# Altium schematic sheet synth-schematic.SchDoc
size B; SheetNumber: 1; SheetTotal: 3
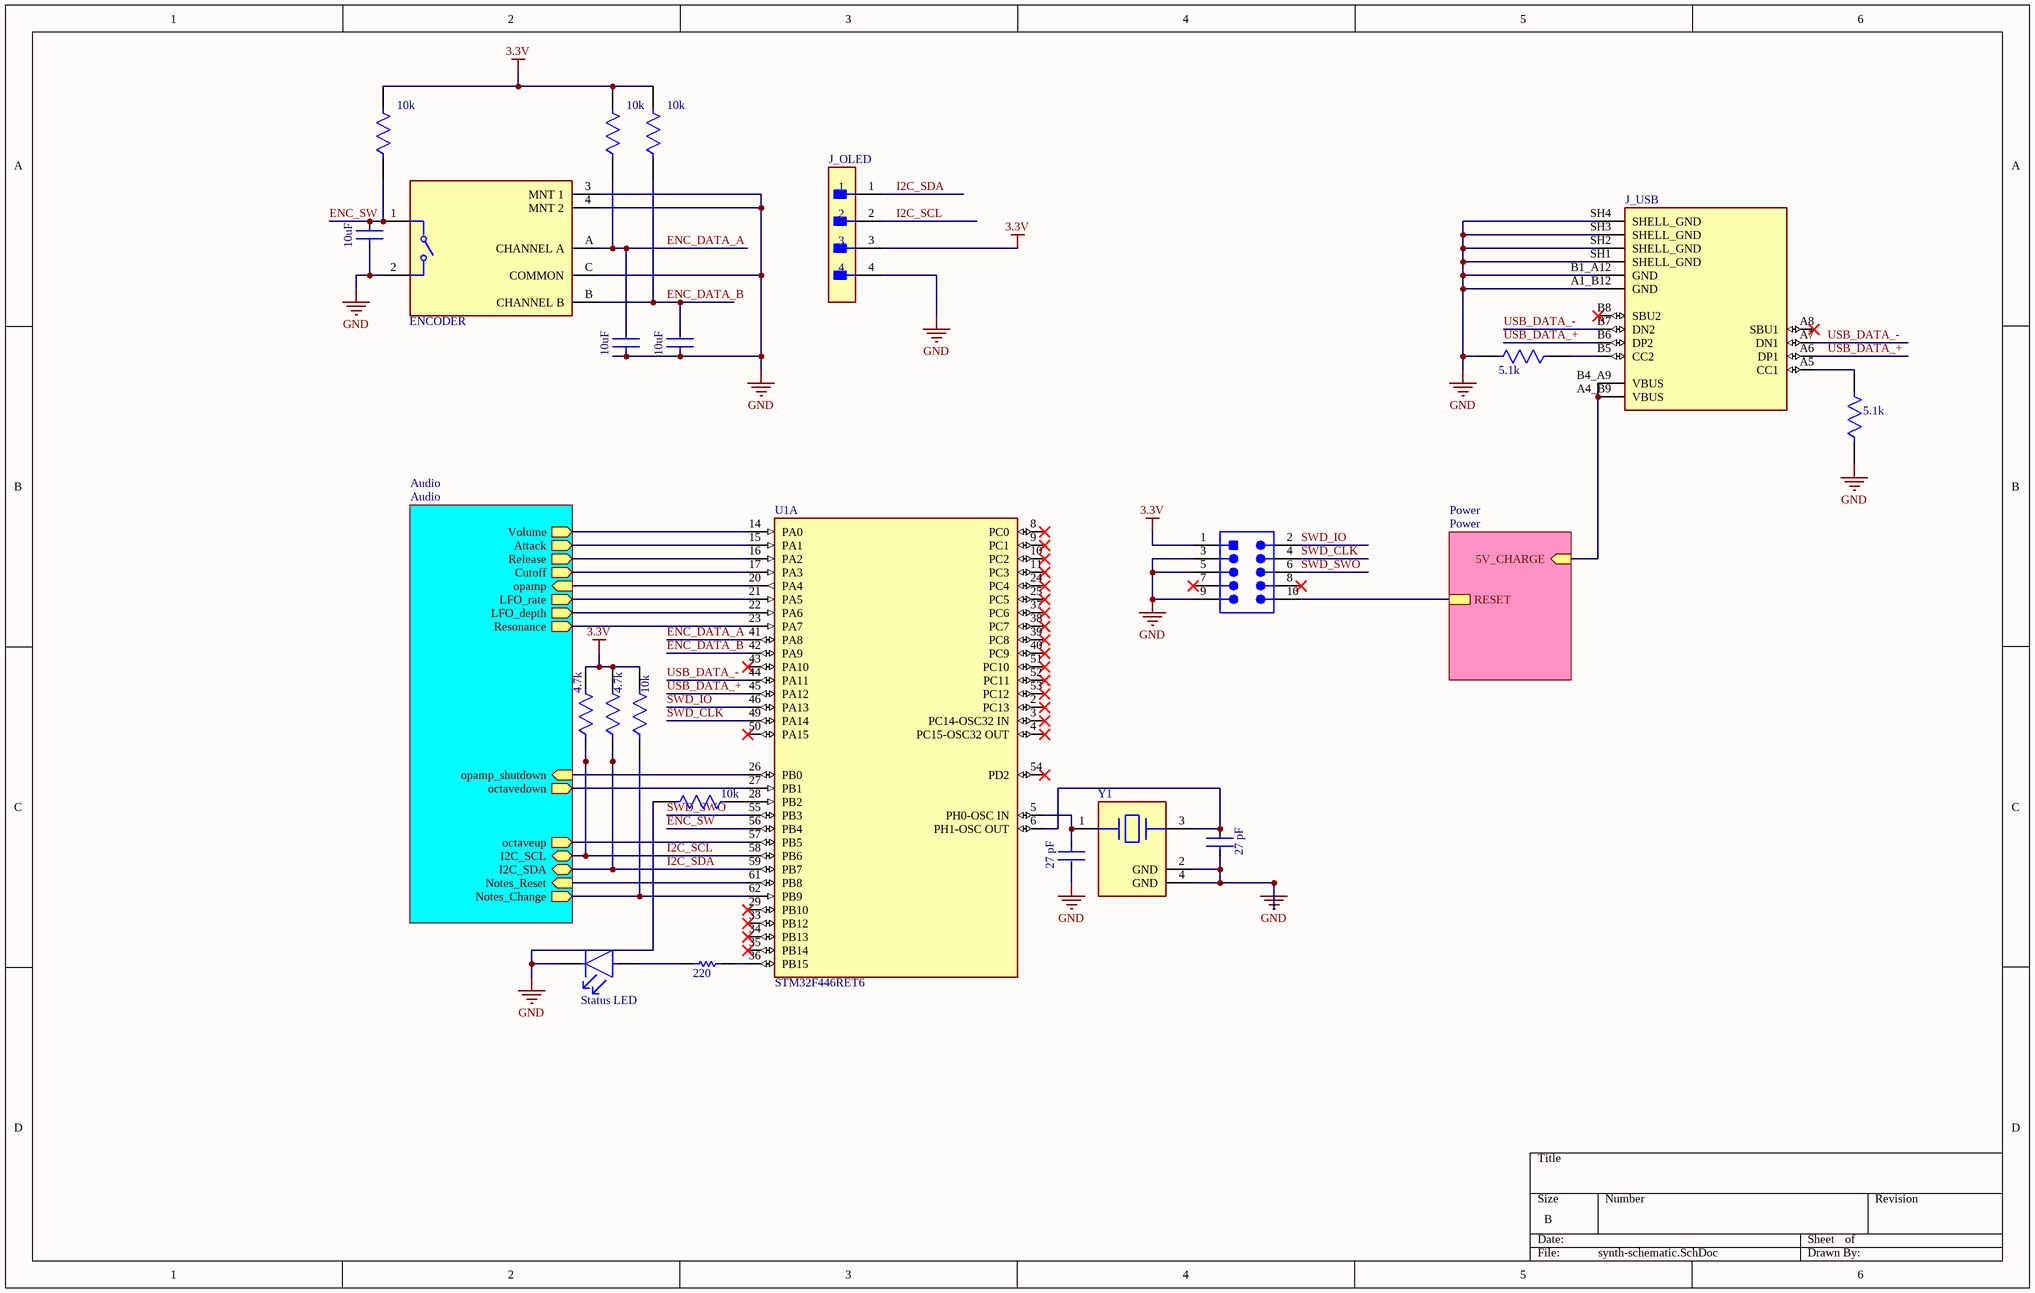
[diagram p0: synth-schematic.SchDoc]

## Parts
C_ENC_A  10uF  [FP-C0603C106M8PACTU-MFG]
C_ENC_B  10uF  [FP-C0603C106M8PACTU-MFG]
C_ENC_SW  10uF  [FP-C0603C106M8PACTU-MFG]
C_Y_1  27 pF  [FP-C0603C-CF-MFG]
C_Y_2  27 pF  [FP-C0603C-CF-MFG]
ENCODER  PEC11R-4215F-S0024  [FP-PEC11R-4215F-S0024-MFG]  (value not drawn)
J_OLED  HTSW-104-07-G-S  [FP-HTSW-104-07-G-S-MFG]  (value not drawn)
J_USB  USB4105-GF-A-120  [GCT_USB4105-GF-A-120]  (value not drawn)
LED_R1  220  [RESC1608X55X25NL10T15]
R_BOOT_PD  10k  [FP-AC0603-IPC_A]
R_ENC_PU_2  10k  [FP-AC0603-IPC_A]
R_ENC_PU_3  10k  [FP-AC0603-IPC_A]
R_ENC_PU_?  10k  [FP-AC0603-IPC_A]
R_NOTES_PU  10k  [FP-AC0603-IPC_A]
R_PULLUP_SCL  4.7k  [FP-RT0603-MFG]
R_PULLUP_SDA  4.7k  [FP-RT0603-MFG]
R_USB_1  5.1k  [FP-MCT0603-IPC_B]
R_USB_2  5.1k  [FP-MCT0603-IPC_B]
STATUS_LED1  Status LED  [FP-LTST-C190KRKT-MFG]
SWD_HEADER  FTSH-105-01-F-DV-K  [SMTC-FTSH-105-01-L-DV-K_V]  (value not drawn)
U1  STM32F446RET6  [FP-LQFP64-5W-MFG]  (part A of 2)
Y1  ABM3B-8.000MHZ-B2-T  [FP-ABM3B-MFG]  (value not drawn)

## Sub-sheets
Audio = Audio: Volume (out), Attack (out), Release (out), Cutoff (out), LFO_rate (out), LFO_depth (out), Resonance (out), opamp (in), opamp_shutdown (in), octavedown (out), Notes_Reset (in), Notes_Change (out), I2C_SDA (bidir), octaveup (out), I2C_SCL (bidir)
Power = Power: 5V_CHARGE (in), RESET

## Nets
3.3V: J_OLED.3 R_ENC_PU_2.2 R_ENC_PU_3.2 R_ENC_PU_?.2 R_NOTES_PU.2 R_PULLUP_SCL.2 R_PULLUP_SDA.2 SWD_HEADER.1
GND: C_ENC_A.1 C_ENC_B.1 C_ENC_SW.1 C_Y_1.1 C_Y_2.2 ENCODER.2 ENCODER.3(MNT_1) ENCODER.4(MNT_2) ENCODER.C(COMMON) J_OLED.4 J_USB.A1_B12(GND) J_USB.B1_A12(GND) J_USB.SH1(SHELL_GND) J_USB.SH2(SHELL_GND) J_USB.SH3(SHELL_GND) J_USB.SH4(SHELL_GND) R_BOOT_PD.2 R_USB_1.1 R_USB_2.2 STATUS_LED1.1(C) SWD_HEADER.3 SWD_HEADER.5 SWD_HEADER.9 Y1.2(GND) Y1.4(GND)
ENC_DATA_A: C_ENC_A.2 ENCODER.A(CHANNEL_A) R_ENC_PU_?.1 U1.41(PA8)
ENC_DATA_B: C_ENC_B.2 ENCODER.B(CHANNEL_B) R_ENC_PU_2.1 U1.42(PA9)
ENC_SW: C_ENC_SW.2 ENCODER.1 R_ENC_PU_3.1 U1.56(PB4)
I2C_SCL: J_OLED.2 R_PULLUP_SCL.1 U1.58(PB6) ; sheet Audio/I2C_SCL
I2C_SDA: J_OLED.1 R_PULLUP_SDA.1 U1.59(PB7) ; sheet Audio/I2C_SDA
SWD_CLK: SWD_HEADER.4 U1.49(PA14)
SWD_IO: SWD_HEADER.2 U1.46(PA13)
SWD_SWO: SWD_HEADER.6 U1.55(PB3)
USB_DATA_+: J_USB.A6(DP1) J_USB.B6(DP2) U1.45(PA12)
USB_DATA_-: J_USB.A7(DN1) J_USB.B7(DN2) U1.44(PA11)
NetC_Y_1_2: C_Y_1.2 U1.6(PH1-OSC_OUT) Y1.3
NetC_Y_2_1: C_Y_2.1 U1.5(PH0-OSC_IN) Y1.1
NetJ_USB_A4_B9: J_USB.A4_B9(VBUS) J_USB.B4_A9(VBUS) ; sheet Power/5V_CHARGE
NetJ_USB_A5: J_USB.A5(CC1) R_USB_1.2
NetJ_USB_B5: J_USB.B5(CC2) R_USB_2.1
NetLED_R1_1: LED_R1.1 STATUS_LED1.2(A)
NetLED_R1_2: LED_R1.2 U1.36(PB15)
NetR_BOOT_PD_1: R_BOOT_PD.1 U1.28(PB2)
NetR_NOTES_PU_1: R_NOTES_PU.1 U1.62(PB9) ; sheet Audio/Notes_Change
NetSWD_HEADER_10: SWD_HEADER.10 ; sheet Power/RESET
NetU1_14: U1.14(PA0) ; sheet Audio/Volume
NetU1_15: U1.15(PA1) ; sheet Audio/Attack
NetU1_16: U1.16(PA2) ; sheet Audio/Release
NetU1_17: U1.17(PA3) ; sheet Audio/Cutoff
NetU1_20: U1.20(PA4) ; sheet Audio/opamp
NetU1_21: U1.21(PA5) ; sheet Audio/LFO_rate
NetU1_22: U1.22(PA6) ; sheet Audio/LFO_depth
NetU1_23: U1.23(PA7) ; sheet Audio/Resonance
NetU1_26: U1.26(PB0) ; sheet Audio/opamp_shutdown
NetU1_27: U1.27(PB1) ; sheet Audio/octavedown
NetU1_57: U1.57(PB5) ; sheet Audio/octaveup
NetU1_61: U1.61(PB8) ; sheet Audio/Notes_Reset

Not connected (* = marked no-connect by the designer): J_USB A8(SBU1)* B8(SBU2)*; SWD_HEADER 7* 8*; U1 2(PC13)* 3(PC14-OSC32_IN)* 4(PC15-OSC32_OUT)* 8(PC0)* 9(PC1)* 10(PC2)* 11(PC3)* 24(PC4)* 25(PC5)* 29(PB10)* 33(PB12)* 34(PB13)* 35(PB14)* 37(PC6)* 38(PC7)* 39(PC8)* 40(PC9)* 43(PA10)* 50(PA15)* 51(PC10)* 52(PC11)* 53(PC12)* 54(PD2)*

## Library data of the parts
C_ENC_A C_ENC_B C_ENC_SW = CMP-03020-034654-1: CAP CER 10UF 10V X5R 0603; RoHS Compliant: Yes
C_Y_1 C_Y_2 = CMP-03020-007366-1: CAP CER 27PF 100V NP0 0603; Manufacturer: KEMET; Manufacturer Part Number: C0603C270F1GACTU; Temperature Characteristic: C0G; Automotive Grade: Grade 1; Temperature Coefficient: 30ppm/°C; Tolerance: 0.01; Category: Cap; Mouser Description: Multilayer Ceramic Capacitors MLCC - SMD/SMT 100volts 27pF C0G 1%; Octopart: https://octopart.com/c0603c270f1gactu-kemet-9143729; ComponentLink2Description: Datasheet; Package: C0603C-CF; Device Class L2: Capacitors; Temperature Range Low: -55°C; Temperature Range High: +125°C; Height: 0.87mm; Digikey Description: CAP CER 27PF 100V NP0 0603; Temperature: -55°C to +125°C; Device Class L1: Passive Components; Value: 27 pF; Lead Free: Yes; Automotive: Yes; RoHS: TRUE; Device Class L3: Ceramic Capacitors; ComponentLink2URL: https://api.kemet.com/component-edge/download/datasheet/C0603C100J5GACAUTO.pdf; Capacitance: 27 pF; Material: Ceramic; Voltage Rating: 100 V
ENCODER = CMP-1747-00012-2: ROTARY ENCODER MECHANICAL 24PPR; Hole Diameter: 1.8mm; Output Type: Quadrature; Pulses per Revolution: 24; Number of Channels: 2; Built in Switch: Yes; Min Operating Temperature: -30°C; Series: PEC11R; Type: Mechanical; Package Quantity: 150; Length: 21.5mm; Max Operating Temperature: 70°C; Encoder Type: Mechanical; Height: 13.4mm; Detent: Yes; Packaging: Bulk; Orientation: Vertical; Width: 12.5mm; Termination: PC Pins; Mount: Through Hole; REACH SVHC: No SVHC; Radiation Hardening: No; RoHS Compliant: Yes
J_OLED = CMP-02766-001776-1: CONN HEADER VERT 4POS 2.54MM; Gender: Male; Number of Contacts: 4; Packaging: Bulk; RoHS Compliant: Yes; Number of Rows: 1; Mount: Through Hole; Contact Material: Bronze; Series: HTSW; Radiation Hardening: No; Pitch: 2.54mm; Reach SVHC Compliant: Yes; Contact Plating: Gold; Termination: Through Hole
J_USB = USB4105-GF-A-120: USB CONN, 2.0 TYPE C, RCPT, 16POS, SMT; USB Connector Type:USB Type C; USB Standard:USB 2.0; Gender:Receptacle; No. of Positions:16Positions; Connector Mounting:Surface Mount, Through Hole Mount; Orientation:Right Angle RoHS Compliant: Yes; MF: Global Connector Technology; MP: USB4105GFA120; SnapEDA_Link: https://www.snapeda.com/parts/USB4105GFA120/Global+Connector+Technology/view-part/?ref=snap; Package: None; Value: *; Check_prices: https://www.snapeda.com/parts/USB4105GFA120/Global+Connector+Technology/view-part/?ref=eda
LED_R1 = CMP-2000-04322-1: Part Number: RC0603JR-13220RL; Manufacturer: Yageo
R_BOOT_PD R_ENC_PU_2 R_ENC_PU_3 R_ENC_PU_? R_NOTES_PU = CMP-03412-040683-1: RES 10kΩ 5.00% 0.2W 0603
R_PULLUP_SCL R_PULLUP_SDA = CMP-03412-034306-1: RT0603 4.7KΩ 0.1W 25 ppm/°C 0.10%; Manufacturer: Yageo; Manufacturer Part Number: RT0603BRD134K7L; Tolerance: 0.001; Voltage Rating: 75V; Series: RT; Device Class L3: Chip SMD Resistors; Temperature Range High: +155°C; Height: 0.55mm; Temperature Range Low: -55°C; Resistance: 4.7KΩ; Composition: Thin Film; Temperature Coefficient: 25 ppm/°C; Device Class L1: Passive Components; Footprint Url: http://www.yageo.com/exep/pages/download/literatures/PYu-R_Mount_10.pdf; Automotive: No; Category: Res; ComponentLink2URL: http://www.yageo.com/documents/recent/PYu-RT_1-to-0.01_RoHS_L_9.pdf; Temperature: -55°C to +155°C; Ipc Land Pattern Name: RESC16080X45; RoHS: TRUE; Power Rating: 0.1W; Octopart: https://octopart.com/rt0603brd134k7l-yageo-91016342; Package: RT0603; Lead Free: Yes; Value: 4.7KΩ; Device Class L2: Resistors; ComponentLink2Description: Datasheet
R_USB_1 R_USB_2 = CMP-02407-010205-1: RES SMD 100 OHM 1% 1/8W 0603; Resistance: 5.1kR; Tolerance: 0.1%; Temperature Coefficient: 25ppm/°C; Max Operating Temperature: 125°C; Radiation Hardening: No; Composition: Thin Film; Height: 450um; Lead Free: Lead Free; Contact Plating: Tin; Length: 1.55mm; Width: 850um; Case/Package: 0603; Min Operating Temperature: -55°C
STATUS_LED1 = CMP-1674-00011-2: LED RED CLEAR CHIP SMD; Reverse Voltage: 5V; Viewing Angle: 130°; Power Rating: 75mW; Test Current: 20mA; Number of Elements: 1; Lens Color: Colorless; Wavelength: 639nm; Dominant Wavelength: 631nm; Lens Style: Diffused; Forward Current: 30mA; Forward Voltage: 2.4V; Luminous Intensity: 54mcd; Color: Red; Case Code (Imperial): 0603; Lens Transparency: Clear; Lead Free: Lead Free; Package Quantity: 1; Packaging: Tape and Reel; Max Operating Temperature: 85°C; Number of Pins: 2; Height: 0.8mm; Case/Package: 0603; Number of LEDs: 1; Width: 0.8mm; Case Code (Metric): 1608; Depth: 0.8mm; Mount: Surface Mount; Radiation Hardening: No; Length: 1.6mm; Illumination Color: Red; Power Dissipation: 75mW; Min Operating Temperature: -55°C
SWD_HEADER = CMP-2000-05352-1: Male Header, Pitch 1.27 mm, 2 x 5 Position, Height 6.12 mm, RoHS, Tube; Manufacturer: Samtec; Number of Positions: 10; Connector Type: Header,Shrouded; Number of Positions Loaded: All; Row Spacing: 0.050"(1.27mm); Fastening Type: -; Package Reference: FTSH-105-01-L-DV-K; Termination: Solder; Package URL: http://suddendocs.samtec.com/prints/ftsh-1xx-xx-xxx-dv-xxx-footprint.pdf; Number of Rows: 2; Contact Finish Thickness: 3µin(0.08µm); Contact Type: MalePin; Manufacturer URL: http://www.samtec.com/; Contact Mating Length: 0.120"(3.05mm); Pitch: 0.050"(1.27mm); Series: FTSH; Features: -; Contact Finish: Gold; Color: Black; Family: RectangularConnectors-Headers,MalePins; Datasheet URL: http://suddendocs.samtec.com/prints/ftsh-1xx-xx-xxx-dv-xxx-mkt.pdf; Package Description: Male Header, Pitch 1.27 mm, 2 x 5 Position, Height 5.97 mm, Tail Length 4.32 mm; Mounting Type: SurfaceMount; Datasheet Version: Rev. ET, 10/1995; Category: Connectors,Interconnects; Packaging: Tube
U1 = CMP-12105-000007-1: IC MCU 32BIT 512KB FLASH 64LQFP; Manufacturer: ST; Number Of Spi Channels: 4; Ram Size: 128KBytes; Standoff Height: 0.05mm; Number Of Uart Channels: 6; Number Of Pwm Channels: 32; Max Junction Temp: +105°C; Number Of I/Os: 50; Number Of Usb Channels: 2; Frequency: 180MHz; Number Of A/D Converters: 3; Max Supply Voltage: 3.6V; Number Of Adc Channels: 16; Interface: I2C,SPI,UART,USART,CAN,USB,LIN,IrDA,I2S,Other; Memory Size: 512KBytes; Number Of Timers/Counters: 14; Min Supply Voltage: 1.7V; Core Architecture: ARM Cortex-M4; Data Bus Width: 32bits; Number Of Cores: 1; Ambient Temperature Range Low: -40°C; ComponentLink2URL: https://www.st.com/en/microcontrollers-microprocessors/stm32f446re.html; Category: IC; Height: 1.6mm; Ipc Land Pattern Name: QFP50P1200X1200X160-64; Manufacturer Part Number: STM32F446RET6; Octopart: https://octopart.com/stm32f446ret6-stmicroelectronics-52642920; Temperature Range High: +105°C; Lead Free: Yes; Mouser Description: ARM Microcontrollers - MCU High-performance and DSP with FP, ARM Cortex-M4 MCU with 512 Kbytes Flash, 180 MHz CPU, Art Accelerator, SDRAM; Digikey Description: IC MCU 32BIT 512KB FLASH 64LQFP; Ambient Temperature Range High: +85°C; Number Of I2C Channels: 4; Memory Type: FLASH; RoHS: TRUE; Automotive: No; Device Class L1: Integrated Circuits (ICs); Temperature: -40°C to +105°C; Device Class L2: Embedded Processors and Controllers; Device Class L3: Microcontrollers; Temperature Range Low: -40°C; Package: LQFP64-5W; ComponentLink2Description: Datasheet
Y1 = CMP-1688-00002-2: Crystal 8MHz ±20ppm 18pF SMD-4 5mm x 3.2mm; ESR (Equivalent Series Resistance): 200R; Frequency Stability: 50ppm; Operating Frequency: 8 MHz; Mount: Surface Mount; Number of Pins: 4; Packaging: Tape and Reel; Width: 0.126inch; Case/Package: CSMD; Lead Free: Lead Free; Depth: 3.2mm; Load Capacitance: 18pF; Min Operating Temperature: -20°C; Series: ABM3B; Package Quantity: 1000; Resistor Type: Ceramic; Height: 0.043inch; Max Operating Temperature: 70°C; Frequency Tolerance: 20ppm; Series Resistance: 200R; Tolerance: 20ppm; Termination: SMD/SMT; Length: 5mm; Frequency: 8MHz